# Altium schematic sheet INTERFACE.SchDoc
size 420 x 297 mm; Author: Лотов М.Д,; Address1: Address1; Address2: Address2; Address3: Address3; Address4: Address4; DocumentNumber: INTERFACE; SheetNumber: 2; SheetTotal: 5; Scale: 1:1; DocumentType: Схема электрическая принципиальная; FirstReferrence: АБВГ.123456.001
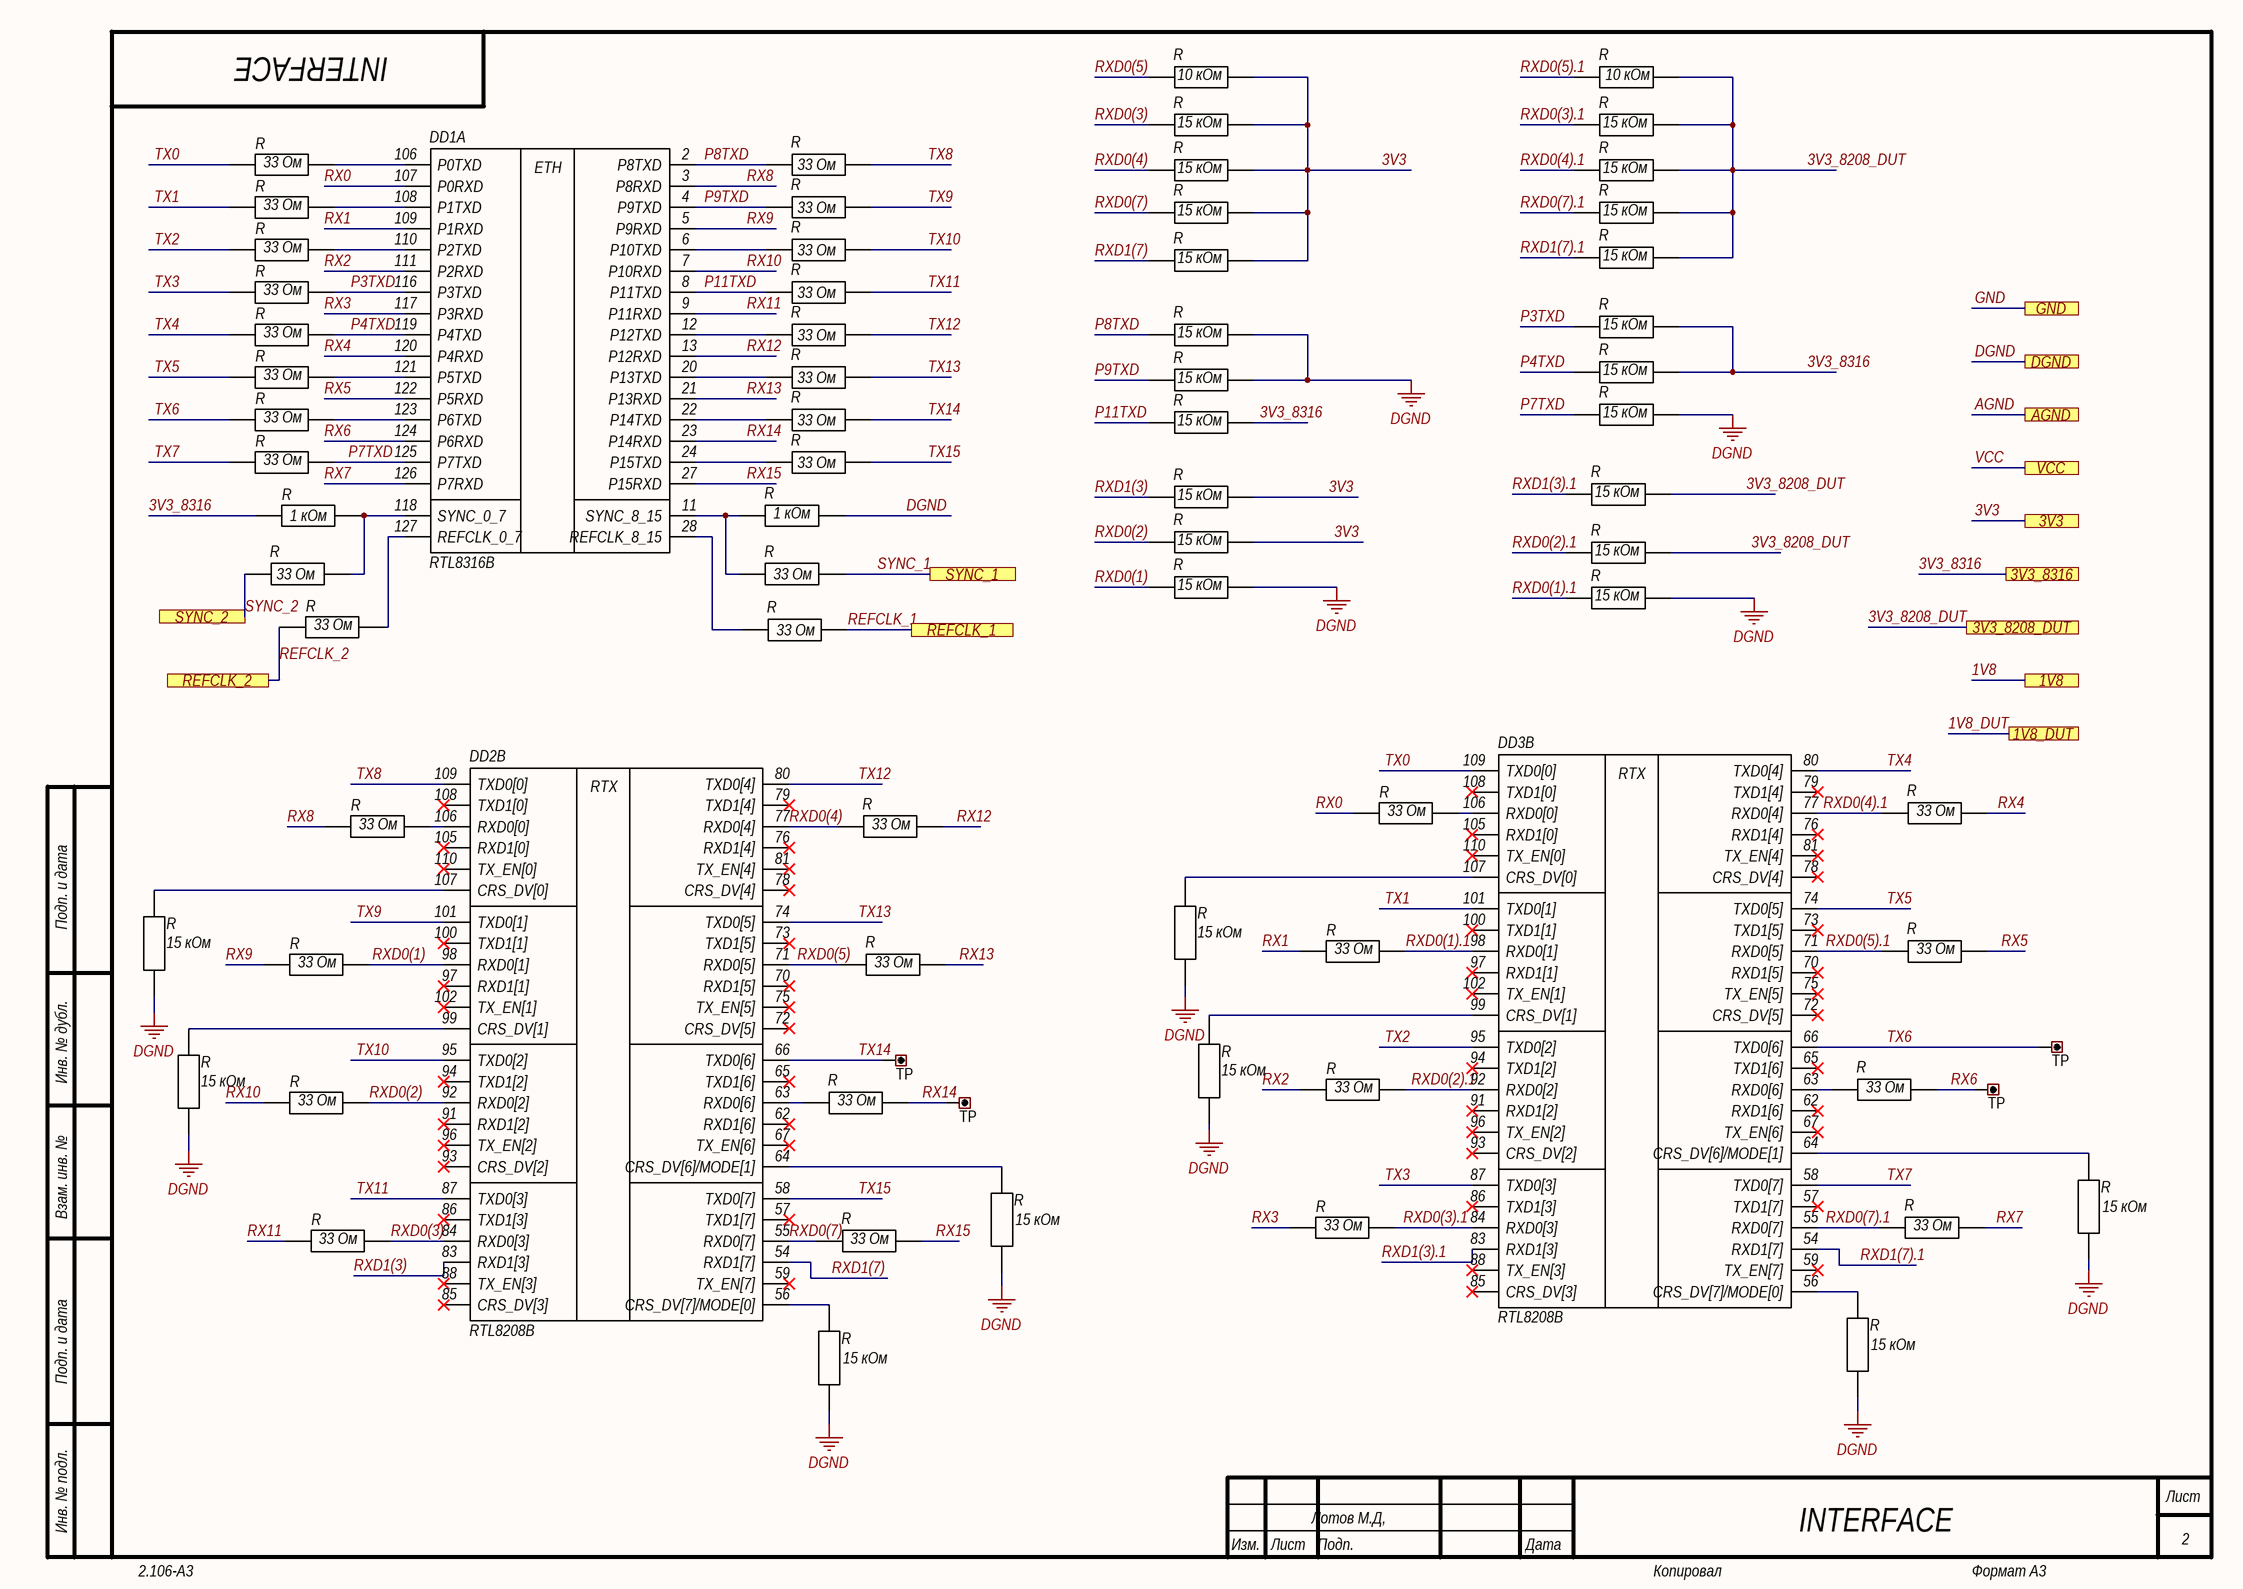
[diagram p0: INTERFACE.SchDoc]

## Parts
(Parts that share a designator on the sheet are numbered #1, #2 ... from top to bottom, then left to right.)
DD1  RTL8316B  [QFP-128_(14x20mm)_0.5mm_ZIF]  (part A of 4)
DD2  RTL8208B  [QFP-128_14x20mm_0.5mm]  (part B of 4)
DD3  RTL8208B  [QFP-128_(14x20mm)_0.5mm_ZIF]  (part B of 4)
R#1  10 кОм  [R0603]
R#2  10 кОм  [R0603]
R#3  15 кОм  [R0603]
R#4  15 кОм  [R0603]
R#5  33 Ом  [R0603]
R#6  33 Ом  [R0603]
R#7  15 кОм  [R0603]
R#8  15 кОм  [R0603]
R#9  33 Ом  [R0603]
R#10  33 Ом  [R0603]
R#11  15 кОм  [R0603]
R#12  15 кОм  [R0603]
R#13  33 Ом  [R0603]
R#14  33 Ом  [R0603]
R#15  15 кОм  [R0603]
R#16  15 кОм  [R0603]
R#17  33 Ом  [R0603]
R#18  33 Ом  [R0603]
R#19  15 кОм  [R0603]
R#20  33 Ом  [R0603]
R#21  33 Ом  [R0603]
R#22  15 кОм  [R0603]
R#23  15 кОм  [R0603]
R#24  33 Ом  [R0603]
R#25  33 Ом  [R0603]
R#26  15 кОм  [R0603]
R#27  15 кОм  [R0603]
R#28  33 Ом  [R0603]
R#29  33 Ом  [R0603]
R#30  15 кОм  [R0603]
R#31  33 Ом  [R0603]
R#32  33 Ом  [R0603]
R#33  15 кОм  [R0603]
R#34  15 кОм  [R0603]
R#35  1 кОм  [R0603]
R#36  1 кОм  [R0603]
R#37  15 кОм  [R0603]
R#38  15 кОм  [R0603]
R#39  33 Ом  [R0603]
R#40  33 Ом  [R0603]
R#41  15 кОм  [R0603]
R#42  15 кОм  [R0603]
R#43  33 Ом  [R0603]
R#44  33 Ом  [R0603]
R#45  33 Ом  [R0603]
R#46  33 Ом  [R0603]
R#47  33 Ом  [R0603]
R#48  33 Ом  [R0603]
R#49  33 Ом  [R0603]
R#50  33 Ом  [R0603]
R#51  33 Ом  [R0603]
R#52  33 Ом  [R0603]
R#53  15 кОм  [R0603]
R#54  15 кОм  [R0603]
R#55  33 Ом  [R0603]
R#56  33 Ом  [R0603]
R#57  33 Ом  [R0603]
R#58  33 Ом  [R0603]
R#59  15 кОм  [R0603]
R#60  15 кОм  [R0603]
R#61  33 Ом  [R0603]
R#62  33 Ом  [R0603]
R#63  33 Ом  [R0603]
R#64  33 Ом  [R0603]
R#65  15 кОм  [R0603]
R#66  15 кОм  [R0603]
R#67  15 кОм  [R0603]
R#68  15 кОм  [R0603]
TP#1  (no value)  [PLS2-1]
TP#2  (no value)  [PLS2-1]
TP#3  (no value)  [PLS2-1]
TP#4  (no value)  [PLS2-1]

## Ports
1V8, 1V8_DUT, 3V3, 3V3_8208_DUT, 3V3_8316, AGND, DGND, GND, REFCLK_1, REFCLK_2, SYNC_1, SYNC_2, VCC

## Nets
DGND: R#22.1(x) R#26.1(x) R#27.1(x) R#36.1(x) R#41.1(x) R#42.1(x) R#53.1(x) R#54.1(x) R#59.1(x) R#60.1(x) R#65.1(x) R#66.1(x) R#67.1(x) R#68.1(x) ; port DGND
1V8: port 1V8
1V8_DUT: port 1V8_DUT
3V3: R#1.1(x) R#3.1(x) R#7.1(x) R#11.1(x) R#15.1(x) R#33.1(x) R#37.1(x) ; port 3V3
3V3_8208_DUT: R#2.1(x) R#4.1(x) R#8.1(x) R#12.1(x) R#16.1(x) R#34.1(x) R#38.1(x) ; port 3V3_8208_DUT
3V3_8316: R#19.1(x) R#23.1(x) R#30.1(x) R#35.1(x) ; port 3V3_8316
AGND: port AGND
GND: port GND
P3TXD: DD1.116(P3TXD) R#17.2 R#19.2
P4TXD: DD1.119(P4TXD) R#20.2 R#23.2
P7TXD: DD1.125(P7TXD) R#27.2 R#31.2
P8TXD: DD1.2(P8TXD) R#6.2 R#22.2
P9TXD: DD1.4(P9TXD) R#10.2 R#26.2
P11TXD: DD1.8(P11TXD) R#18.2 R#30.2
REFCLK_1: R#44.1(x) ; port REFCLK_1
REFCLK_2: R#43.1(x) ; port REFCLK_2
RX0: DD1.107(P0RXD) R#45.1(x)
RX1: DD1.109(P1RXD) R#49.1(x)
RX2: DD1.111(P2RXD) R#55.1(x)
RX3: DD1.117(P3RXD) R#61.1(x)
RX4: DD1.120(P4RXD) R#46.1(x)
RX5: DD1.122(P5RXD) R#50.1(x)
RX6: DD1.124(P6RXD) R#56.1(x) TP#3.1
RX7: DD1.126(P7RXD) R#62.1(x)
RX8: DD1.3(P8RXD) R#47.1(x)
RX9: DD1.5(P9RXD) R#51.1(x)
RX10: DD1.7(P10RXD) R#57.1(x)
RX11: DD1.9(P11RXD) R#63.1(x)
RX12: DD1.13(P12RXD) R#48.1(x)
RX13: DD1.21(P13RXD) R#52.1(x)
RX14: DD1.23(P14RXD) R#58.1(x) TP#4.1
RX15: DD1.27(P15RXD) R#64.1(x)
RXD0(1): DD2.98(RXD0[1]) R#41.2 R#51.2
RXD0(1).1: DD3.98(RXD0[1]) R#42.2 R#49.2
RXD0(2): DD2.92(RXD0[2]) R#37.2 R#57.2
RXD0(2).1: DD3.92(RXD0[2]) R#38.2 R#55.2
RXD0(3): DD2.84(RXD0[3]) R#3.2 R#63.2
RXD0(3).1: DD3.84(RXD0[3]) R#4.2 R#61.2
RXD0(4): DD2.77(RXD0[4]) R#7.2 R#48.2
RXD0(4).1: DD3.77(RXD0[4]) R#8.2 R#46.2
RXD0(5): DD2.71(RXD0[5]) R#1.2 R#52.2
RXD0(5).1: DD3.71(RXD0[5]) R#2.2 R#50.2
RXD0(7): DD2.55(RXD0[7]) R#11.2 R#64.2
RXD0(7).1: DD3.55(RXD0[7]) R#12.2 R#62.2
RXD1(3): DD2.83(RXD1[3]) R#33.2
RXD1(3).1: DD3.83(RXD1[3]) R#34.2
RXD1(7): DD2.54(RXD1[7]) R#15.2
RXD1(7).1: DD3.54(RXD1[7]) R#16.2
SYNC_1: R#40.1(x) ; port SYNC_1
SYNC_2: R#39.1(x) ; port SYNC_2
TX0: DD3.109(TXD0[0]) R#5.1(x)
TX1: DD3.101(TXD0[1]) R#9.1(x)
TX2: DD3.95(TXD0[2]) R#13.1(x)
TX3: DD3.87(TXD0[3]) R#17.1(x)
TX4: DD3.80(TXD0[4]) R#20.1(x)
TX5: DD3.74(TXD0[5]) R#24.1(x)
TX6: DD3.66(TXD0[6]) R#28.1(x) TP#1.1
TX7: DD3.58(TXD0[7]) R#31.1(x)
TX8: DD2.109(TXD0[0]) R#6.1(x)
TX9: DD2.101(TXD0[1]) R#10.1(x)
TX10: DD2.95(TXD0[2]) R#14.1(x)
TX11: DD2.87(TXD0[3]) R#18.1(x)
TX12: DD2.80(TXD0[4]) R#21.1(x)
TX13: DD2.74(TXD0[5]) R#25.1(x)
TX14: DD2.66(TXD0[6]) R#29.1(x) TP#2.1
TX15: DD2.58(TXD0[7]) R#32.1(x)
VCC: port VCC
NetDD1_6: DD1.6(P10TXD) R#14.2
NetDD1_11: DD1.11(SYNC_8_15) R#36.2 R#40.2
NetDD1_12: DD1.12(P12TXD) R#21.2
NetDD1_20: DD1.20(P13TXD) R#25.2
NetDD1_22: DD1.22(P14TXD) R#29.2
NetDD1_24: DD1.24(P15TXD) R#32.2
NetDD1_28: DD1.28(REFCLK_8_15) R#44.2
NetDD1_106: DD1.106(P0TXD) R#5.2
NetDD1_108: DD1.108(P1TXD) R#9.2
NetDD1_110: DD1.110(P2TXD) R#13.2
NetDD1_118: DD1.118(SYNC_0_7) R#35.2 R#39.2
NetDD1_121: DD1.121(P5TXD) R#24.2
NetDD1_123: DD1.123(P6TXD) R#28.2
NetDD1_127: DD1.127(REFCLK_0_7) R#43.2
NetDD2_56: DD2.56(CRS_DV[7]/MODE[0]) R#68.2
NetDD2_63: DD2.63(RXD0[6]) R#58.2
NetDD2_64: DD2.64(CRS_DV[6]/MODE[1]) R#66.2
NetDD2_99: DD2.99(CRS_DV[1]) R#60.2
NetDD2_106: DD2.106(RXD0[0]) R#47.2
NetDD2_107: DD2.107(CRS_DV[0]) R#54.2
NetDD3_56: DD3.56(CRS_DV[7]/MODE[0]) R#67.2
NetDD3_63: DD3.63(RXD0[6]) R#56.2
NetDD3_64: DD3.64(CRS_DV[6]/MODE[1]) R#65.2
NetDD3_99: DD3.99(CRS_DV[1]) R#59.2
NetDD3_106: DD3.106(RXD0[0]) R#45.2
NetDD3_107: DD3.107(CRS_DV[0]) R#53.2

Not connected (* = marked no-connect by the designer): DD2 57(TXD1[7])* 59(TX_EN[7])* 62(RXD1[6])* 65(TXD1[6])* 67(TX_EN[6])* 70(RXD1[5])* 72(CRS_DV[5])* 73(TXD1[5])* 75(TX_EN[5])* 76(RXD1[4])* 78(CRS_DV[4])* 79(TXD1[4])* 81(TX_EN[4])* 85(CRS_DV[3])* 86(TXD1[3])* 88(TX_EN[3])* 91(RXD1[2])* 93(CRS_DV[2])* 94(TXD1[2])* 96(TX_EN[2])* 97(RXD1[1])* 100(TXD1[1])* 102(TX_EN[1])* 105(RXD1[0])* 108(TXD1[0])* 110(TX_EN[0])*; DD3 57(TXD1[7])* 59(TX_EN[7])* 62(RXD1[6])* 65(TXD1[6])* 67(TX_EN[6])* 70(RXD1[5])* 72(CRS_DV[5])* 73(TXD1[5])* 75(TX_EN[5])* 76(RXD1[4])* 78(CRS_DV[4])* 79(TXD1[4])* 81(TX_EN[4])* 85(CRS_DV[3])* 86(TXD1[3])* 88(TX_EN[3])* 91(RXD1[2])* 93(CRS_DV[2])* 94(TXD1[2])* 96(TX_EN[2])* 97(RXD1[1])* 100(TXD1[1])* 102(TX_EN[1])* 105(RXD1[0])* 108(TXD1[0])* 110(TX_EN[0])*

## Notes on the sheet
- Подп. и дата
- Инв. № дубл.
- Взам. инв. №
- Инв. № подл.
- Изм.
- Лист
- Подп.
- Дата
- 2.106-A3
- Копировал
- Формат А3
- (in symbol RTL8208B, part B) RTX
- (in symbol RTL8316B, part A) ETH

## Library data of the parts
R#1-R#68 = Resistor_SMD
TP#1-TP#4 = Connector_Test_Point: Manufacturer: Keystone; ValueManufacturerPartNumber: Test point, Keystone, 5001; PartNumber: 5001; TypeConnector: Test point; HelpURL: https://www.digikey.com/product-detail/en/keystone-electronics/5001/36-5001-ND/255327